# Altium project HMS.PhaoDien.V6.0.PrjPcb (part 2 of 2)
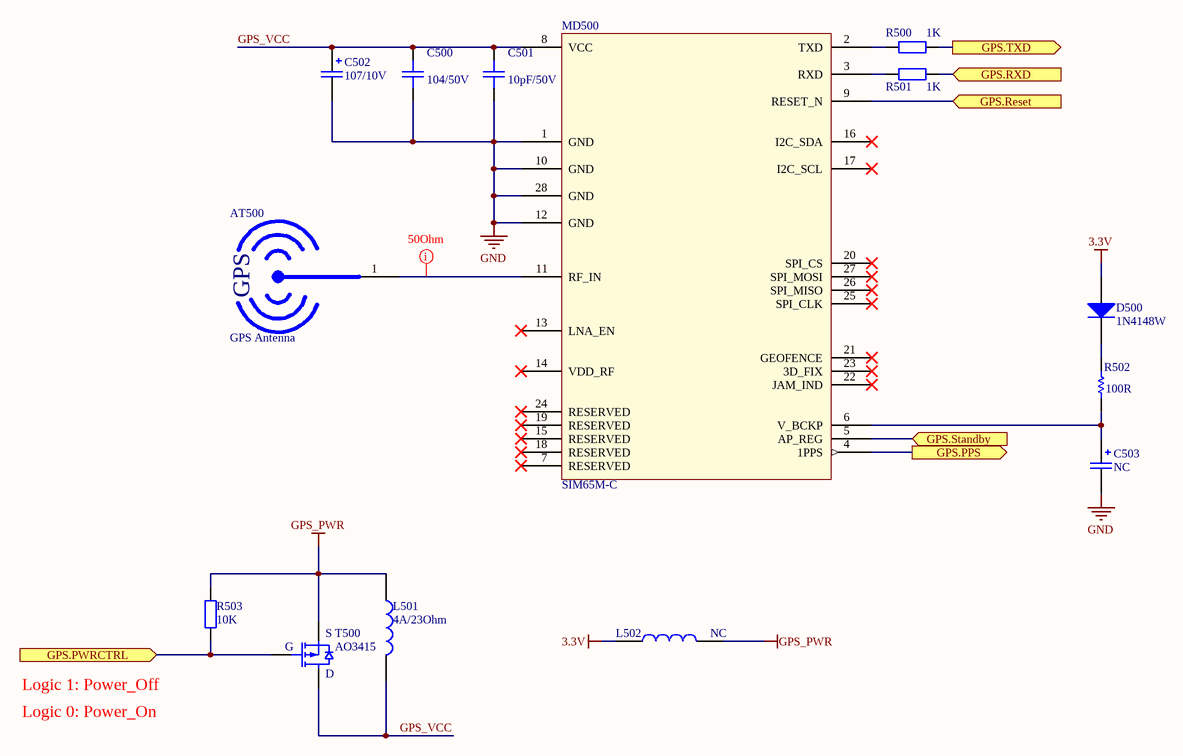
[diagram p10: HMS.LC76G.SchDoc]

## Nets that join several sheets
3.3V: HMS.STM32L151CBT6 (12 pins), HMS.Power (C208.2 C209.1 L203.2 U202.2), HMS.VS1838B (`.1 R300.2), HMS_Solar (U900.4), HMS.LC76G (D500.1 L502.1)
GND: HMS.STM32L151CBT6 (15 pins), HMS.Bootloader (P100.5 P100.8), HMS.LedCtrl (13 pins), HMS.Power (15 pins), HMS.VS1838B (P300.2), HMS_NiMHCharge (9 pins), HMS_Solar (5 pins), HMS.SIM.A7682S (P2.2), HMS.LC76G (8 pins)
V_BAT: HMS_NiMHCharge (D.2 P800.1 R802.2 T800.2), HMS_Solar (D903.1)
V_SOLAR: HMS_NiMHCharge (C802.1 D800.1 R800.2), HMS_Solar (6 pins)
V_SYSTEM: HMS.Power (F200.1), HMS_Solar (D901.2 D903.2)
VIN: HMS.LedCtrl (R603.1 U601.3 U601.5), HMS.Power (F200.2 L200.1)
VOUT: HMS.Power (6 pins), HMS.SIM.A7682S (P2.1)
NetC603_2: HMS.STM32L151CBT6 (U400.17), HMS.LedCtrl (C603.2 R606.2)
NetC801_2: HMS.STM32L151CBT6 (U400.27), HMS_NiMHCharge (C801.2 R800.1 R803.2)
NetC803_2: HMS.STM32L151CBT6 (U400.18), HMS_NiMHCharge (C803.2 R802.1 R804.2)
NetC900_2: HMS.STM32L151CBT6 (U400.28), HMS_Solar (C900.2 R900.1 R901.2)
NetIC_2: HMS.STM32L151CBT6 (U400.16), HMS.LedCtrl (IC.2 R620.2)
NetMD500_4: HMS.STM32L151CBT6 (U400.33), HMS.LC76G (MD500.4)
NetMD500_5: HMS.STM32L151CBT6 (U400.39), HMS.LC76G (MD500.5)
NetMD500_9: HMS.STM32L151CBT6 (U400.32), HMS.LC76G (MD500.9)
NetP2_4: HMS.STM32L151CBT6 (U400.45), HMS.SIM.A7682S (P2.4)
NetP2_5: HMS.STM32L151CBT6 (U400.13), HMS.SIM.A7682S (P2.5)
NetP2_6: HMS.STM32L151CBT6 (U400.15), HMS.SIM.A7682S (P2.6)
NetP2_7: HMS.STM32L151CBT6 (U400.46), HMS.SIM.A7682S (P2.7)
NetP2_8: HMS.STM32L151CBT6 (U400.41), HMS.SIM.A7682S (P2.8)
NetP2_9: HMS.STM32L151CBT6 (U400.43), HMS.SIM.A7682S (P2.9)
NetP2_10: HMS.STM32L151CBT6 (U400.42), HMS.SIM.A7682S (P2.10)
NetP100_3: HMS.STM32L151CBT6 (U400.37), HMS.Bootloader (P100.3)
NetP100_7: HMS.STM32L151CBT6 (U400.34), HMS.Bootloader (P100.7)
NetP300_1: HMS.STM32L151CBT6 (U400.26), HMS.VS1838B (P300.1 R300.1)
NetR100_2: HMS.STM32L151CBT6 (U400.21), HMS.Bootloader (R100.2)
NetR102_2: HMS.STM32L151CBT6 (U400.22), HMS.Bootloader (R102.2)
NetR500_2: HMS.STM32L151CBT6 (U400.31), HMS.LC76G (R500.2)
NetR501_2: HMS.STM32L151CBT6 (U400.30), HMS.LC76G (R501.2)
NetR503_1: HMS.STM32L151CBT6 (U400.29), HMS.LC76G (R503.1 T500.1)
NetR604_1: HMS.STM32L151CBT6 (U400.11), HMS.LedCtrl (R604.1)
NetR805_1: HMS.STM32L151CBT6 (U400.19), HMS_NiMHCharge (R805.1)
NetR902_2: HMS.STM32L151CBT6 (U400.10), HMS_Solar (R902.2 U900.3)
NetT300_1: HMS.STM32L151CBT6 (U400.38), HMS.VS1838B (T300.1)
USART2.TX: HMS.STM32L151CBT6 (R1000.1 U400.12), HMS.SIM.A7682S (P2.3)

## Assembly variants
PHAODIEN_GPS_LTE: not fitted L203
PHAODIEN_GPS: not fitted 700 AT700 AT701 C201 C208 C209 C700 C701 C703 C704 C705 C706 C707 C708 C709 C730 H700 L202 L700 L701 P700 Q700 Q701 R700 R701 R702 R703 R704 R705 R706 R707 R708 R709 R710 R711 R712 R713 R714 R715 R716 R717 R718 R719 R720 R721 R722 R777 T700 T701 U202 U700 U701